# Altium project demo.PrjPcb
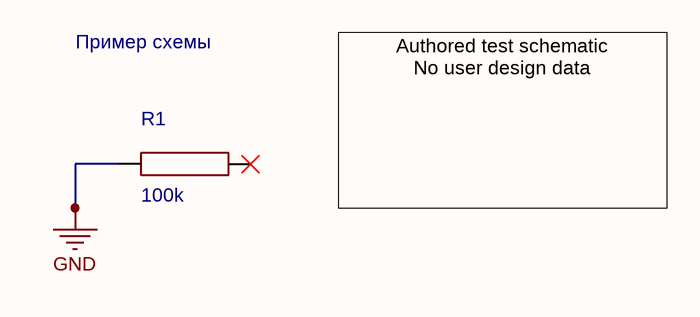
[diagram p0: minimal.SchDoc]
1 sheet, 1 parts. Net scope: global (net labels, ports and power ports of the same name join across sheets).
Board file: editor-v2.PcbDoc

## Sheet minimal.SchDoc: Import fixture
size A4

### Parts
R1  100k

### Nets
GND: R1.1

Not connected (* = marked no-connect by the designer): R1 2*

### Notes on the sheet
- Пример схемы
- Authored test schematic
  No user design data

### Library data of the parts
R1 = Resistor